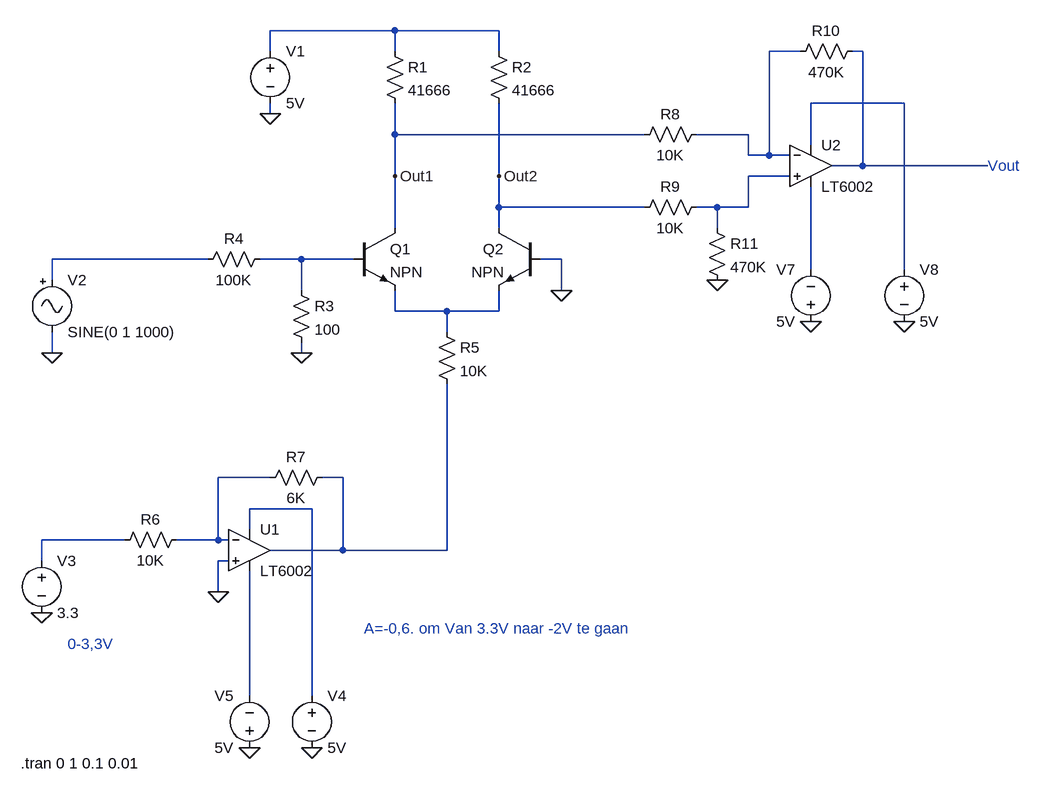
[diagram p0: schematic VCA.asc]
VCA.asc, the LTspice schematic file:
Version 4.1
SHEET 1 2228 1224
WIRE 128 80 -64 80
WIRE 288 80 128 80
WIRE -64 112 -64 80
WIRE 128 112 128 80
WIRE 288 112 288 80
WIRE 752 112 704 112
WIRE 848 112 832 112
WIRE 912 192 768 192
WIRE -64 208 -64 192
WIRE 128 240 128 192
WIRE 512 240 128 240
WIRE 672 240 592 240
WIRE 768 256 768 192
WIRE 672 272 672 240
WIRE 704 272 704 112
WIRE 704 272 672 272
WIRE 736 272 704 272
WIRE 848 288 848 112
WIRE 848 288 800 288
WIRE 1040 288 848 288
WIRE 128 304 128 240
WIRE 288 304 288 192
WIRE 736 304 672 304
WIRE 288 352 288 304
WIRE 512 352 288 352
WIRE 624 352 592 352
WIRE 672 352 672 304
WIRE 672 352 624 352
WIRE 128 384 128 304
WIRE 288 384 288 352
WIRE 624 384 624 352
WIRE -160 432 -400 432
WIRE -16 432 -80 432
WIRE 64 432 -16 432
WIRE 384 432 352 432
WIRE 768 448 768 320
WIRE 912 448 912 192
WIRE -400 464 -400 432
WIRE -16 480 -16 432
WIRE 384 480 384 432
WIRE 128 512 128 480
WIRE 208 512 128 512
WIRE 288 512 288 480
WIRE 288 512 208 512
WIRE 208 544 208 512
WIRE -400 576 -400 544
WIRE -16 576 -16 560
WIRE -64 768 -144 768
WIRE 48 768 16 768
WIRE 0 816 -96 816
WIRE -96 848 -96 816
WIRE -288 864 -416 864
WIRE -144 864 -144 768
WIRE -144 864 -208 864
WIRE -128 864 -144 864
WIRE 48 880 48 768
WIRE 48 880 -64 880
WIRE 208 880 208 624
WIRE 208 880 48 880
WIRE -416 896 -416 864
WIRE -128 896 -144 896
WIRE -144 944 -144 896
WIRE -96 1104 -96 912
WIRE 0 1104 0 816
FLAG 128 304 Out1
FLAG 288 304 Out2
FLAG -64 208 0
FLAG -16 576 0
FLAG 384 480 0
FLAG -400 576 0
FLAG -144 944 0
FLAG -96 1184 0
FLAG 0 1184 0
FLAG -416 976 0
FLAG 624 464 0
FLAG 768 528 0
FLAG 912 528 0
SYMBOL voltage -64 96 R0
SYMATTR InstName V1
SYMATTR Value 5V
SYMBOL res 112 96 R0
SYMATTR InstName R1
SYMATTR Value 41666
SYMBOL res 272 96 R0
SYMATTR InstName R2
SYMATTR Value 41666
SYMBOL npn 64 384 R0
SYMATTR InstName Q1
SYMBOL npn 352 384 M0
SYMATTR InstName Q2
SYMBOL res -32 464 R0
SYMATTR InstName R3
SYMATTR Value 100
SYMBOL res -64 416 R90
WINDOW 0 0 56 VBottom 2
WINDOW 3 32 56 VTop 2
SYMATTR InstName R4
SYMATTR Value 100K
SYMBOL Misc\\signal -400 448 R0
WINDOW 123 0 0 Left 0
WINDOW 39 0 0 Left 0
SYMATTR InstName V2
SYMATTR Value SINE(0 1 1000)
SYMBOL res 192 528 R0
SYMATTR InstName R5
SYMATTR Value 10K
SYMBOL OpAmps\\LT6002 -96 880 R0
SYMATTR InstName U1
SYMBOL res -192 848 R90
WINDOW 0 0 56 VBottom 2
WINDOW 3 32 56 VTop 2
SYMATTR InstName R6
SYMATTR Value 10K
SYMBOL res 32 752 R90
WINDOW 0 0 56 VBottom 2
WINDOW 3 32 56 VTop 2
SYMATTR InstName R7
SYMATTR Value 6K
SYMBOL voltage 0 1088 R0
SYMATTR InstName V4
SYMATTR Value 5V
SYMBOL voltage -96 1200 R180
WINDOW 0 24 96 Left 2
WINDOW 3 24 16 Left 2
SYMATTR InstName V5
SYMATTR Value 5V
SYMBOL voltage -416 880 R0
SYMATTR InstName V3
SYMATTR Value 3.3
SYMBOL res 608 224 R90
WINDOW 0 0 56 VBottom 2
WINDOW 3 32 56 VTop 2
SYMATTR InstName R8
SYMATTR Value 10K
SYMBOL OpAmps\\LT6002 768 288 R0
SYMATTR InstName U2
SYMBOL res 608 336 R90
WINDOW 0 0 56 VBottom 2
WINDOW 3 32 56 VTop 2
SYMATTR InstName R9
SYMATTR Value 10K
SYMBOL voltage 768 544 R180
WINDOW 0 24 96 Left 2
WINDOW 3 24 16 Left 2
SYMATTR InstName V7
SYMATTR Value 5V
SYMBOL voltage 912 432 R0
SYMATTR InstName V8
SYMATTR Value 5V
SYMBOL res 848 96 R90
WINDOW 0 0 56 VBottom 2
WINDOW 3 32 56 VTop 2
SYMATTR InstName R10
SYMATTR Value 470K
SYMBOL res 608 368 R0
SYMATTR InstName R11
SYMATTR Value 470K
TEXT -448 1208 Left 2 !.tran 0 1 0.1 0.01
TEXT 80 1000 Left 2 ;A=-0,6. om Van 3.3V naar -2V te gaan
TEXT 1040 288 Left 2 ;Vout
TEXT -376 1024 Left 2 ;0-3,3V

The netlist it stands for:
* VCA.asc
V1 N001 0 5V
R1 N001 Out1 41666
R2 N001 Out2 41666
Q1 Out1 N007 N009 0 NPN
Q2 Out2 0 N009 0 NPN
R3 N007 0 100
R4 N007 N006 100K
V2 N006 0 SINE(0 1 1000)
R5 N009 N011 10K
* U1: LT6002 (symbol OpAmps\LT6002 not available, pins judged from their places): In+=0 In-=N010 V+=N012 V-=N014 OUT=N011
R6 N010 N013 10K
R7 N011 N010 6K
V4 N012 0 5V
V5 0 N014 5V
V3 N013 0 3.3
R8 N002 Out1 10K
* U2: LT6002 (symbol OpAmps\LT6002 not available, pins judged from their places): In+=N005 In-=N002 V+=N004 V-=N008 OUT=N003
R9 N005 Out2 10K
V7 0 N008 5V
V8 N004 0 5V
R10 N003 N002 470K
R11 N005 0 470K
.model NPN NPN
.model PNP PNP
.lib standard.bjt
.tran 0 1 0.1 0.01
* A=-0,6. om Van 3.3V naar -2V te gaan
* Vout
* 0-3,3V
.backanno
.end